# Altium schematic sheet Tracker-Sheet.SchDoc (part 3 of 3)
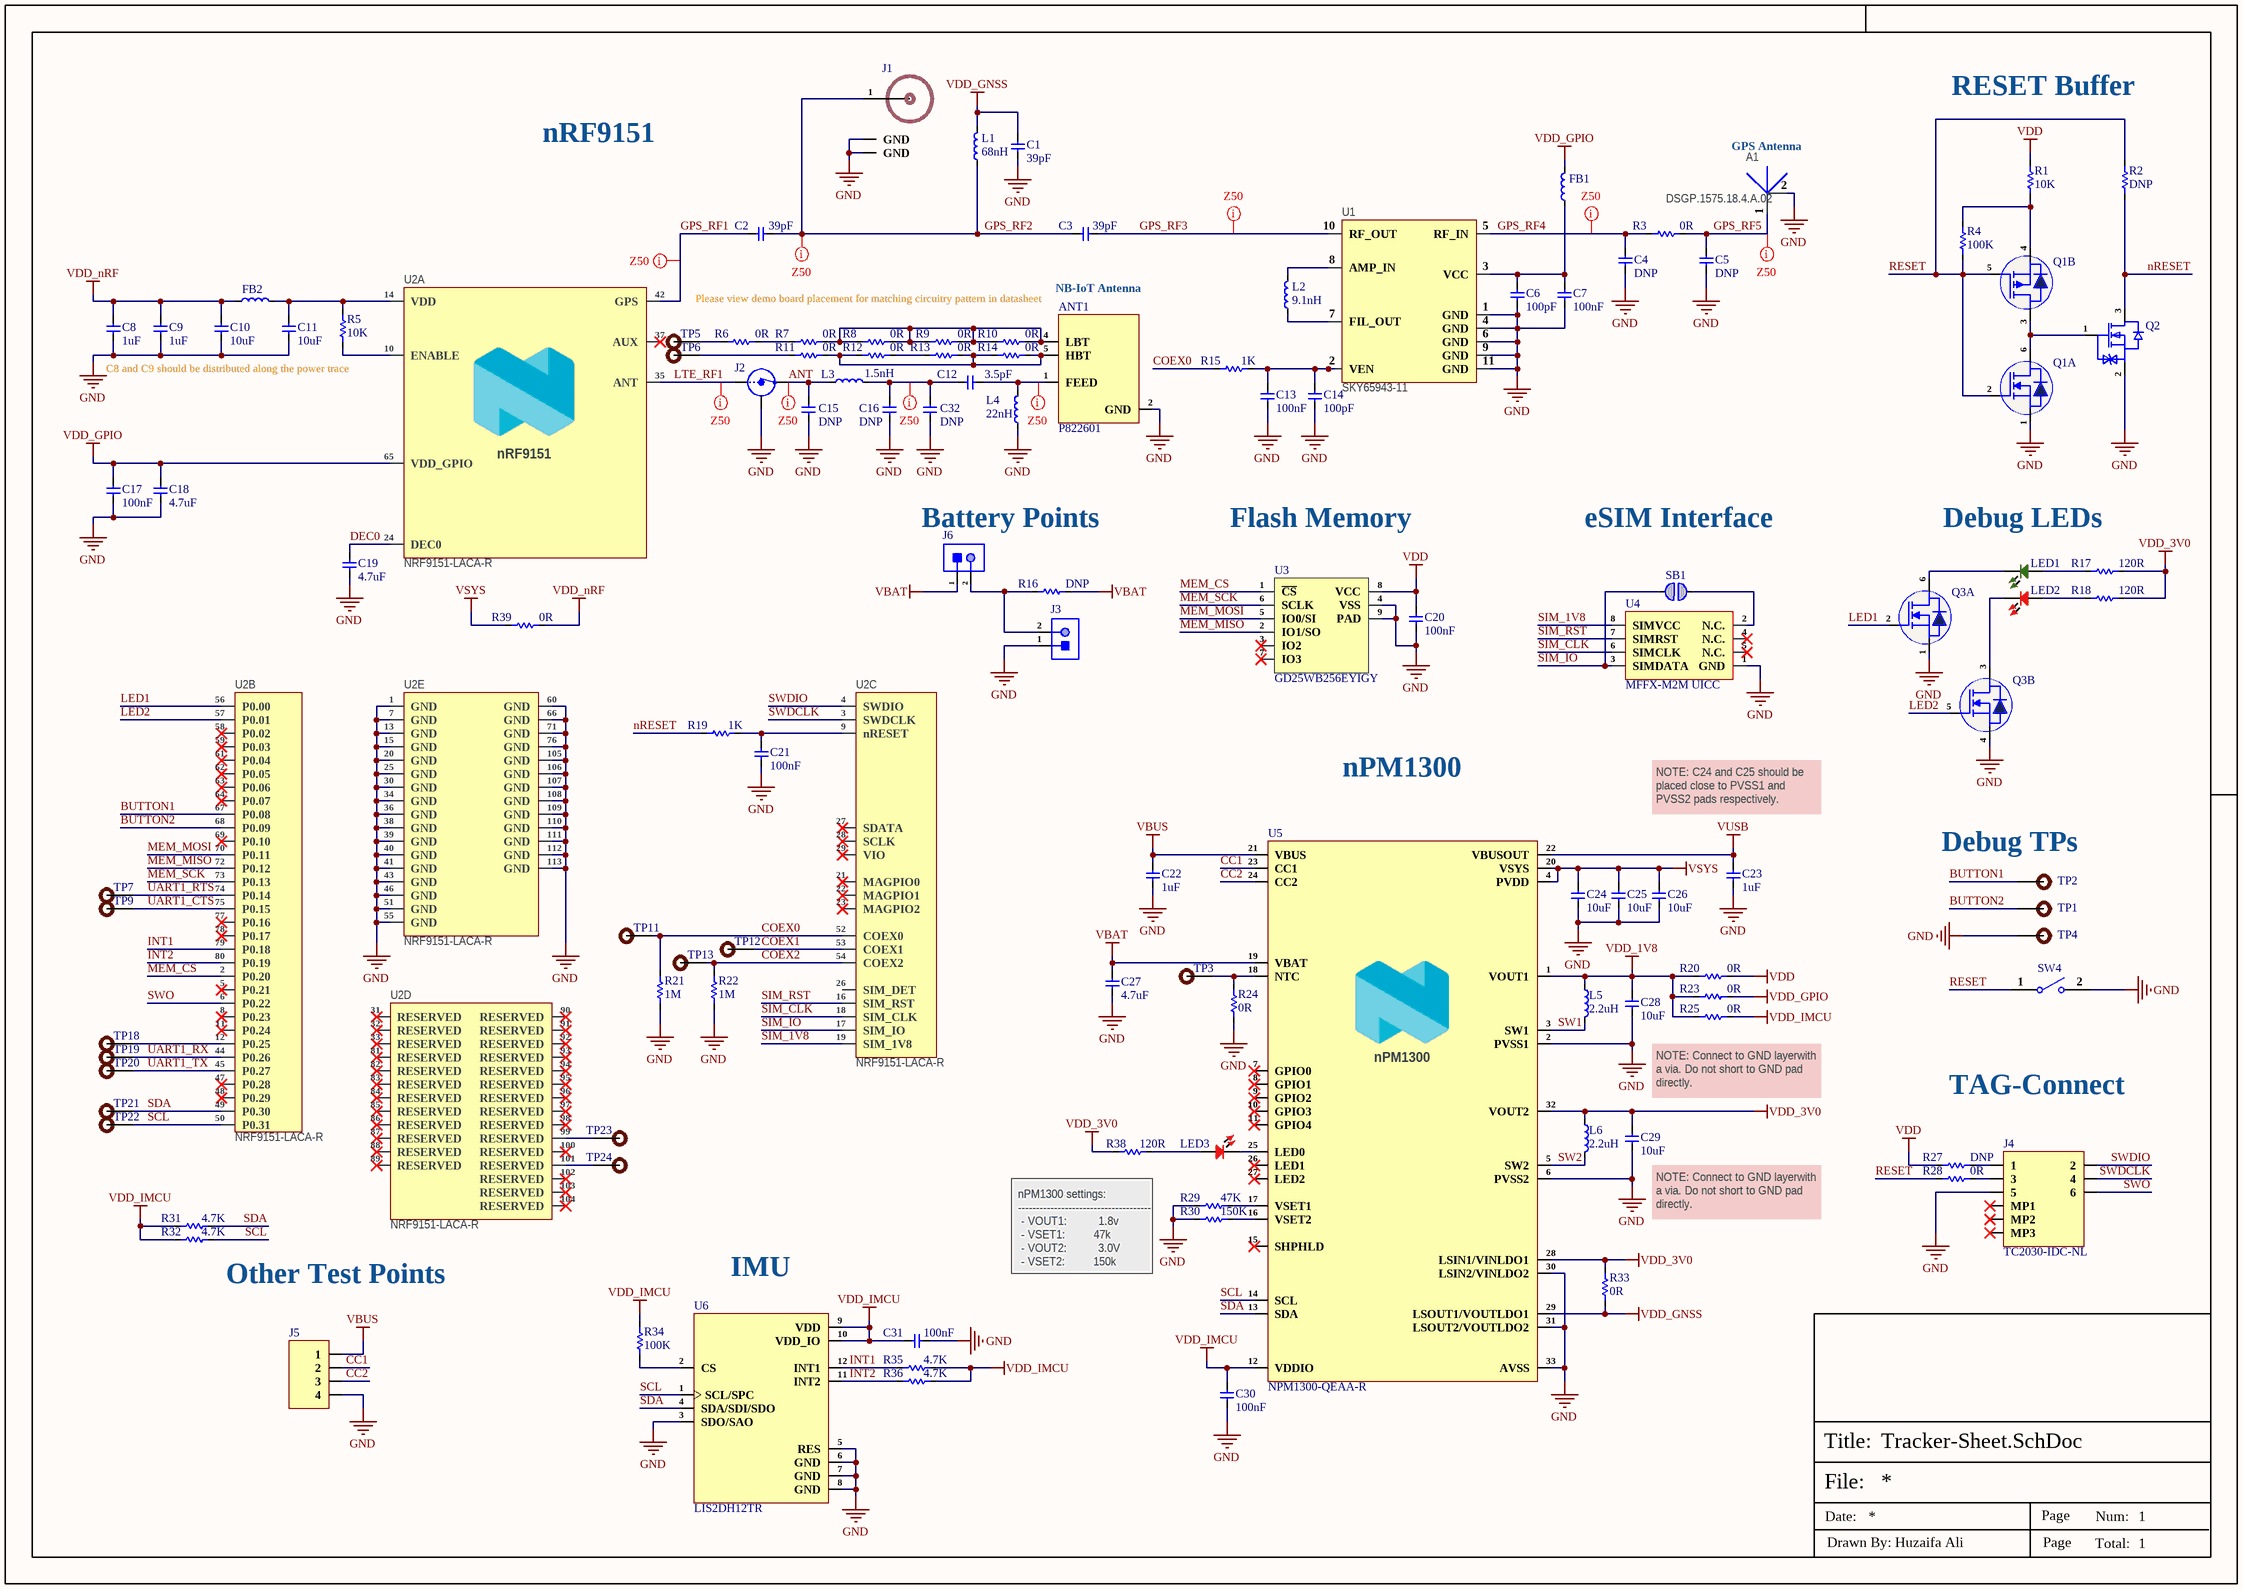
[diagram p2: Tracker-Sheet.SchDoc]

## Library data of the parts (continued)
U2 = NRF9151-LACA-R: IC RF TXRX + MCU CELL; Part Number: nRF9151-LACAA0A; Manufacturer: Nordic Semiconductor; Component Status: Active; Pad Count: 113; Value: nRF9151-LACAA0A; Note: N.A.; Component Class: Nordic_Devices; Author: kod1; Manufacturer Part Number: NRF9151-LACA-R; ComponentLink1URL: N.A.; ComponentLink1Description: Datasheet; ComponentLink2URL: N.A.; ComponentLink2Description: Supplier link; HelpURL: N.A.; LatestRevisionDate: 2024-04-29; Published: 2024-04-29; Footprint Doc: LGA-113; Supplier 1: Nordic Semiconductor; Supplier Part Number 1: nRF9151-LACAA0A; Supplier 2: N.A.; Supplier Part Number 2: N.A.; Artikkelnr Noca: N.A.; Part number IPS: N.A.; Part number Norautron: N.A.
U3 = GD25WB256EYIGY: IC FLASH 256MBIT SPI/QUAD 8WSON; Manufacturer: GigaDevice; Supplier: Digikey; Supplier Part Number: 1970-GD25WB256EYIGY-ND; Manufacturer Part Number: GD25WB256EYIGY; RoHS: No; Item Type: IC
U4 = MFFX-M2M UICC: E-SIM IC; Manufacturer: -; Manufacturer Part Number: MFFX-M2M UICC; Package: MFFX; Item Type: IC
U5 = NPM1300-QEAA-R: PMIC (POWER MANAGEMENT IC) WITH; Manufacturer: Nordic Semiconductor; Supplier: Digikey; Supplier Part Number: 4823-NPM1300-QEAA-RCT-ND; Manufacturer Part Number: NPM1300-QEAA-R; RoHS: No; Item Type: IC; Stock: 2826; Pricing: 1=4.13, 100=3.23, 500=2.55, 1000=2.22001 (USD)
U6 = LIS2DH12TR: ACCEL 2-16G I2C/SPI 12LGA; Manufacturer: STMicroelectronics; Item Type: Sensor; Operating Supply Voltage: 2.5V; Supplier: Future Electronics; LCSC Part Number: C110926; Manufacturer Part Number: LIS2DH12TR; RoHS: Yes; Stock: 64000; Pricing: 8000=0.9 (USD); Lead Free: 5697LeadFree; ComponentLink1URL: https://datasheet.ciiva.com/46423/1836729-46423946.pdf?src-supplier=Element14; ComponentLink1Description: https://datasheet.ciiva.com/46423/1836729-46423946.pdf?src-supplier=Element14